# Altium schematic sheet Pic_Sheet.SchDoc
size A4; SheetNumber: 3; SheetTotal: 4
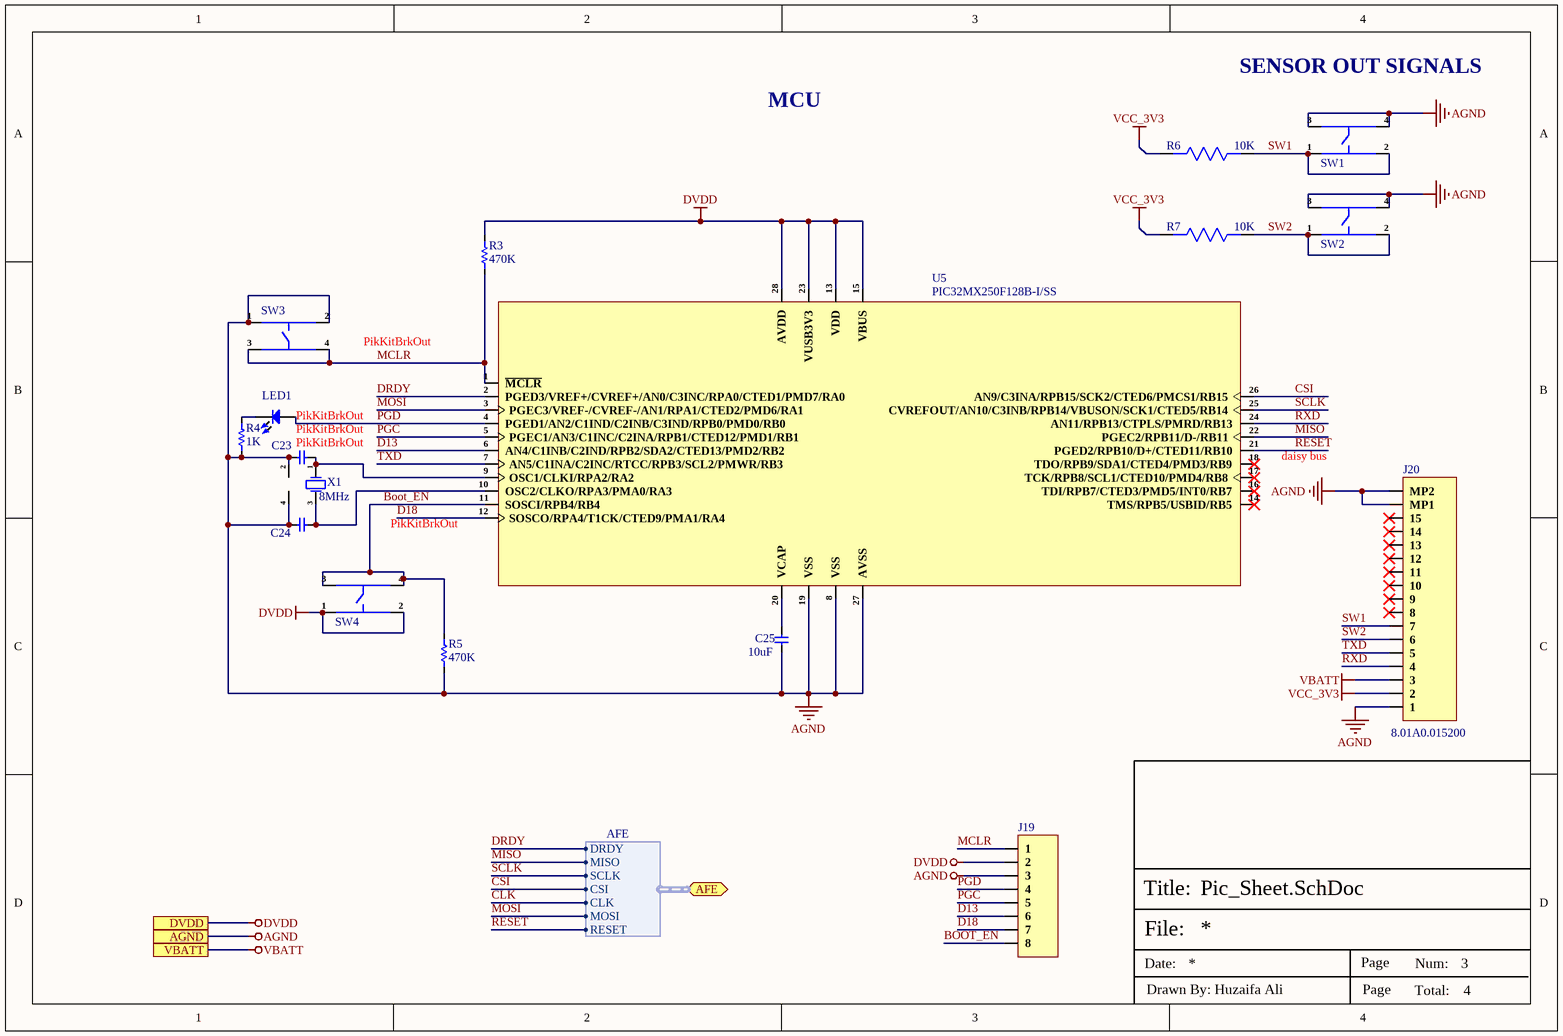
[diagram p0: Pic_Sheet.SchDoc]

## Parts
C23  25pF  [Cap-0402]  (value not drawn)
C24  25pF  [Cap-0402]  (value not drawn)
C25  10uF  [Cap-0402]
J19  SMD PADS (1x8) 2.54mm  [SMD PADS (1x8) 2.54mm]  (value not drawn)
J20  8.01A0.015200  [8.01A0.015200]
LED1  150060BS75000  [LED-0603]  (value not drawn)
R3  470K  [Res-0402]
R4  1K  [Res-0402]
R5  470K  [Res-0402]
R6  10K  [Res-0402]
R7  10K  [Res-0402]
SW1  PTS810SJK250SMTRLFS  [PTS810SJK250SMTR LFS]  (value not drawn)
SW2  PTS810SJK250SMTRLFS  [PTS810SJK250SMTR LFS]  (value not drawn)
SW3  PTS810SJK250SMTRLFS  [PTS810SJK250SMTR LFS]  (value not drawn)
SW4  PTS810SJK250SMTRLFS  [PTS810SJK250SMTR LFS]  (value not drawn)
U5  PIC32MX250F128B-I/SS  [SSOP-28-208mil]
X1  8MHz  [SMD6035-4P]

## Ports
AFE (bidir, harness AFE), AGND, DVDD, VBATT

## Harnesses
AFE: MISO, DRDY, SCLK, CSI, CLK, MOSI, RESET

## Nets
AGND: C23.1 C24.1 C25.1 J19.3 J20.1 J20.MP1 J20.MP2 R4.1 R5.1 SW1.3 SW1.4 SW2.3 SW2.4 SW3.1 SW3.2 U5.8(VSS) U5.19(VSS) U5.27(AVSS) X1.2(GND) X1.4(GND) ; port AGND
DVDD: J19.2 R3.2 SW4.1 SW4.2 U5.13(VDD) U5.15(VBUS) U5.23(VUSB3V3) U5.28(AVDD) ; port DVDD
VBATT: J20.3 ; port VBATT
VCC_3V3: J20.2 R6.2 R7.2
Boot_EN: J19.8 R5.2 SW4.3 SW4.4 U5.11(SOSCI/RPB4/RB4)
CLK: port AFE.CLK
CSI: U5.26(AN9/C3INA/RPB15/SCK2/CTED6/PMCS1/RB15) ; port AFE.CSI
D13: J19.6 U5.6(AN4/C1INB/C2IND/RPB2/SDA2/CTED13/PMD2/RB2)
D18: J19.7 U5.12(SOSCO/RPA4/T1CK/CTED9/PMA1/RA4)
DRDY: U5.2(PGED3/VREF+/CVREF+/AN0/C3INC/RPA0/CTED1/PMD7/RA0) ; port AFE.DRDY
MCLR: J19.1 R3.1 SW3.3 SW3.4 U5.1(~{MCLR})
MISO: U5.22(PGEC2/RPB11/D-/RB11) ; port AFE.MISO
MOSI: U5.3(PGEC3/VREF-/CVREF-/AN1/RPA1/CTED2/PMD6/RA1) ; port AFE.MOSI
PGC: J19.5 U5.5(PGEC1/AN3/C1INC/C2INA/RPB1/CTED12/PMD1/RB1)
PGD: J19.4 LED1.1 U5.4(PGED1/AN2/C1IND/C2INB/C3IND/RPB0/PMD0/RB0)
RESET: U5.21(PGED2/RPB10/D+/CTED11/RB10) ; port AFE.RESET
RXD: J20.4 U5.24(AN11/RPB13/CTPLS/PMRD/RB13)
SCLK: U5.25(CVREFOUT/AN10/C3INB/RPB14/VBUSON/SCK1/CTED5/RB14) ; port AFE.SCLK
SW1: J20.7 R6.1 SW1.1 SW1.2
SW2: J20.6 R7.1 SW2.1 SW2.2
TXD: J20.5 U5.7(AN5/C1INA/C2INC/RTCC/RPB3/SCL2/PMWR/RB3)
NetC23_2: C23.2 U5.9(OSC1/CLKI/RPA2/RA2) X1.1(OSC1)
NetC24_2: C24.2 U5.10(OSC2/CLKO/RPA3/PMA0/RA3) X1.3(OSC2)
NetC25_2: C25.2 U5.20(VCAP)
NetLED1_2: LED1.2 R4.2

Not connected (* = marked no-connect by the designer): J20 8* 9* 10* 11* 12* 13* 14* 15*; U5 14(TMS/RPB5/USBID/RB5)* 16(TDI/RPB7/CTED3/PMD5/INT0/RB7)* 17(TCK/RPB8/SCL1/CTED10/PMD4/RB8)* 18(TDO/RPB9/SDA1/CTED4/PMD3/RB9)*

## Notes on the sheet
- MCU
- SENSOR OUT SIGNALS
- PikKitBrkOut
- (near LED1) PikKitBrkOut
- (near C23) PikKitBrkOut
- (near U5) daisy bus
- File:
- Title:
- Date:
- Page
- Num:
- Total:
- Drawn By: Huzaifa Ali

## Library data of the parts
C23 C24 = CC0402JRNPO9BN250: CAP CER 25PF 50V C0G/NPO 0402; Manufacturer: Yageo; Item Type: Capacitors; Supplier: Mouser; LCSC Part Number: C541363; Manufacturer Part Number: CC0402JRNPO9BN250; RoHS: Yes; Stock: 230189; Case/Package: 0402; Pricing: 1=0.1, 10=0.02, 50=0.02, 100=0.012, 1000=0.01, 10000=0.007 (USD)
C25 = CL05A106MP5NUNC: CAP CER 10UF 10V X5R 0402; Manufacturer: Samsung; Tolerance: 20%; Item Type: Capacitor; Supplier 1: Avnet; Manufacturer Part Number: CL05A106MP5NUNC; RoHS: Yes; Category: Ceramic Capacitors; Stock 1: 1729850; Pricing 1: 10000=0.02537 (USD); Mount: Surface Mount; Case/Package: 0402; Case Code (Metric): 1005; Case Code (Imperial): 0402; Contact Plating: Tin; Min Operating Temperature: -55°C; Max Operating Temperature: 85°C; Package Quantity: 1; Packaging: Tape and Reel; Capacitance: 10uF; Voltage Rating: 10V; Dielectric: X5R; Termination: Wraparound; Series: CL; Construction: Flat; Length: 1mm; Width: 0.02inch; Thickness: 0.028inch; Depth: 0.5mm; Radiation Hardening: No; Lead Free: Lead Free; RoHS Compliant: Yes; ComponentLink1URL: https://datasheet.ciiva.com/25721/cl05a106mp5nunc-25721584.pdf?src-supplier=Digi-Key; ComponentLink1Description: https://datasheet.ciiva.com/25721/cl05a106mp5nunc-25721584.pdf?src-supplier=Digi-Key; ComponentLink2URL: https://datasheet.ciiva.com/26838/getdatasheetpartid-745310-26838170.pdf?src-supplier=Verical; ComponentLink2Description: https://datasheet.ciiva.com/26838/getdatasheetpartid-745310-26838170.pdf?src-supplier=Verical; Supplier Part Number 1: CL05A106MP5NUNC; LCSC Part Number: C315248
J20 = 8.01A0.015200: -40℃~+80℃ 15P Dual-sided contacts / top and bottom connection 0.5mm SMD,P=0.5mm,Surface Mount，Right Angle FFC, FPC (Flat Flexible) Connector Assemblies ROHS; Manufacturer: DIANWEI; Item Type: FFC, FPC Connector; Manufacturer Part Number: 8.01A0.015200; Package: SMD,P=0.5mm,Surface Mount，Right Angle; LCSC Part Number: C19188796; ComponentLink1Description: LCSC; ComponentLink1URL: https://www.lcsc.com/product-detail/FFC-FPC-Flat-Flexible-Connector-Assemblies_DIANWEI-8-01A0-015200_C19188796.html?s_z=n_HC-FPC-05-20-15RLTAG
LED1 = 150060BS75000: LED BLUE CLEAR 0603 SMD; Manufacturer: Wurth Electronics; Manufacturer Part Number: 150060RS75000; Item Type: LEDs; Color: Red; Lens Color: Colorless; Viewing Angle: 140°; Lens Style: Clear,Flat,Rectangular; Luminous Intensity: 250mcd; Forward Current: 30mA; Forward Voltage: 2V; Wavelength: 625nm; Test Current: 20mA; Max Reverse Voltage (DC): 5V; Power Dissipation: 72mW; Lens Size: 0.7mm; Supplier: Rs; LCSC Part Number: C5197644; RoHS: Yes; Stock: 15900; Mounting Technology: Surface Mount; Case/Package: 0603; Case Code (Metric): 1608; Case Code (Imperial): 0603; Min Operating Temperature: -40°C; Max Operating Temperature: 85°C; Package Quantity: 1; Packaging: Cut Tape; Dominant Wavelength: 625nm; Series: WL-SMCW; Lens Transparency: Clear; Reverse Voltage: 5V; Length: 1.6mm; Width: 0.8mm; Height: 0.8mm; RoHS Compliant: Yes; Reach SVHC Compliant: Unknown; ComponentLink1URL: https://datasheet.ciiva.com/29563/150060rs75000-29563040.pdf?src-supplier=Digikey; ComponentLink1Description: https://datasheet.ciiva.com/29563/150060rs75000-29563040.pdf?src-supplier=Digikey; ComponentLink2URL: https://datasheet.ciiva.com/29279/759428-da-01-en-chipled-0603-w-kl-rot-150060rs75000-29279196.pdf?src-supplier=Conrad; ComponentLink2Description: https://datasheet.ciiva.com/29279/759428-da-01-en-chipled-0603-w-kl-rot-150060rs75000-29279196.pdf?src-supplier=Conrad
R3 R5 = RC0402FR-07470KL: RES 470K OHM 1% 1/16W 0402; Manufacturer: Yageo; Value: 470kR; Power Rating: 62.5mW; Voltage Rating: 50V; Temperature Coefficient: 100ppm/°C; Max Power Dissipation: 63mW; Item Type: Resistor; Supplier: Future Electronics; Supplier Part Number: 7702467; Manufacturer Part Number: RC0402FR-07470KL; RoHS: Yes; Category: Chip SMD Resistors; Stock: 330000; Pricing: 10000=0.0009, 50000=0.0008, 300000=0.0008, 1000000=0.0007, 3000000=0.0007 (USD); Case/Package: 0402; Pins: 2; Case Code (Imperial): 0402; Case Code (Metric): 1005; Min Operating Temperature: -55°C; Max Operating Temperature: 155°C; Tolerance: 1%; Packaging: Tape and Reel; Voltage Rating (DC): 50V; Package Quantity: 1; Termination: SMD/SMT; Resistor Type: Thick Film; Number of Terminations: 2; Features: Moisture Resistant; Series: RC; Resistance Tolerance: 1%; Construction: Rectangular; Technology: THICK FILM; Voltage Rating (AC): 50V; Length: 0.039inch; Width: 0.02inch; Height: 0.016inch; Depth: 0.5mm; RoHS Compliant: Yes; Reach SVHC Compliant: No; Military Standard: Not; Lead Free: 5697LeadFree; ComponentLink1URL: https://datasheet.ciiva.com/11819/0900766b80c66297-11819514.pdf?src-supplier=Rs; ComponentLink1Description: https://datasheet.ciiva.com/11819/0900766b80c66297-11819514.pdf?src-supplier=Rs; ComponentLink2URL: https://datasheet.ciiva.com/46412/1018594-46412837.pdf?src-supplier=Element14; ComponentLink2Description: https://datasheet.ciiva.com/46412/1018594-46412837.pdf?src-supplier=Element14; ComponentLink3URL: https://datasheet.ciiva.com/2453/pyu-r-int-thick-7-2453434.pdf?src-supplier=Digi-Key; ComponentLink3Description: https://datasheet.ciiva.com/2453/pyu-r-int-thick-7-2453434.pdf?src-supplier=Digi-Key; ComponentLink4URL: https://datasheet.ciiva.com/2453/pyu-r-int-thick-7-2453435.pdf?src-supplier=Digi-Key; ComponentLink4Description: https://datasheet.ciiva.com/2453/pyu-r-int-thick-7-2453435.pdf?src-supplier=Digi-Key; ComponentLink5URL: https://datasheet.ciiva.com/2453/pyu-r-int-thick-7-2453433.pdf?src-supplier=Digi-Key; ComponentLink5Description: https://datasheet.ciiva.com/2453/pyu-r-int-thick-7-2453433.pdf?src-supplier=Digi-Key; ComponentLink6URL: https://datasheet.ciiva.com/7850/1018594-7850012.pdf?src-supplier=Element14; ComponentLink6Description: https://datasheet.ciiva.com/7850/1018594-7850012.pdf?src-supplier=Element14; ComponentLink7URL: https://datasheet.ciiva.com/7850/1018594-7850013.pdf?src-supplier=Element14; ComponentLink7Description: https://datasheet.ciiva.com/7850/1018594-7850013.pdf?src-supplier=Element14; ComponentLink8URL: https://datasheet.ciiva.com/15189/getdatasheetpartid-325138-15189462.pdf?src-supplier=Verical; ComponentLink8Description: https://datasheet.ciiva.com/15189/getdatasheetpartid-325138-15189462.pdf?src-supplier=Verical; LCSC Part Number: C137976
R4 = RC0402FR-071KL: RES 1K OHM 1% 1/16W 0402; Manufacturer: Yageo; Resistance: 1kR; Temperature Coefficient: 100ppm/°C; Voltage Rating (DC): 50V; Power Rating: 62.5mW; Max Power Dissipation: 63mW; Item Type: Resistor; Supplier 1: Avnet; Manufacturer Part Number: RC0402FR-071KL; RoHS: Yes; Category: Chip SMD Resistors; Stock 1: 13030000; Pricing 1: 10000=0.00085, 20000=0.00087, 40000=0.00084, 60000=0.00083, 80000=0.00079, 100000=0.00078, 1000000=0.00076 (USD); Case/Package: 0402; Number of Pins: 2; Case Code (Imperial): 0402; Case Code (Metric): 1005; Size Code: 0402; Min Operating Temperature: -55°C; Max Operating Temperature: 155°C; Resistor Type: Thick Film; Tolerance: 1%; Packaging: Tape and Reel; Voltage Rating: 50V; Termination: SMD/SMT; Features: Moisture Resistant; Series: RC; Number of Terminations: 2; Resistance Tolerance: 1%; Construction: Rectangular; Technology: THICK FILM; Length: 1mm; Width: 0.5mm; Height: 0.32mm; Depth: 0.5mm; Reach SVHC Compliant: Yes; Lead Free: Lead Free; RoHS Compliant: Yes; Military Standard: Not; ComponentLink1URL: https://datasheet.ciiva.com/11819/0900766b80c66297-11819477.pdf?src-supplier=RSComponents; ComponentLink1Description: https://datasheet.ciiva.com/11819/0900766b80c66297-11819477.pdf?src-supplier=RSComponents; ComponentLink2URL: https://datasheet.ciiva.com/7983/1018594-7983502.pdf?src-supplier=Element14; ComponentLink2Description: https://datasheet.ciiva.com/7983/1018594-7983502.pdf?src-supplier=Element14; ComponentLink3URL: https://datasheet.ciiva.com/22747/1018594-22747513.pdf?src-supplier=Element14; ComponentLink3Description: https://datasheet.ciiva.com/22747/1018594-22747513.pdf?src-supplier=Element14; ComponentLink4URL: https://datasheet.ciiva.com/12666/pyu-rc0402-51-rohs-l-6-r-12666741.pdf?src-supplier=Mouser; ComponentLink4Description: https://datasheet.ciiva.com/12666/pyu-rc0402-51-rohs-l-6-r-12666741.pdf?src-supplier=Mouser; ComponentLink5URL: https://datasheet.ciiva.com/7849/1018594-7849869.pdf?src-supplier=Element14; ComponentLink5Description: https://datasheet.ciiva.com/7849/1018594-7849869.pdf?src-supplier=Element14; ComponentLink6URL: https://datasheet.ciiva.com/7849/1018594-7849871.pdf?src-supplier=Element14; ComponentLink6Description: https://datasheet.ciiva.com/7849/1018594-7849871.pdf?src-supplier=Element14; ComponentLink7URL: https://datasheet.ciiva.com/17063/pyu-rc0402-51-rohs-l-6-r-17063193.pdf?src-supplier=Future+Electronics; ComponentLink7Description: https://datasheet.ciiva.com/17063/pyu-rc0402-51-rohs-l-6-r-17063193.pdf?src-supplier=Future+Electronics; Supplier Part Number 1: RC0402FR-071KL; LCSC Part Number: C106235
R6 R7 = RC0402FR-0710KL: RES 10K OHM 1% 1/16W 0402; Manufacturer: Yageo; Resistance: 10kR; Temperature Coefficient: 100ppm/°C; Voltage Rating (DC): 50V; Power Rating: 62.5mW; Max Power Dissipation: 63mW; Supplier 1: Mouser; Manufacturer Part Number: RC0402FR-0710KL; Stock 1: 18648329; Pricing 1: 1=0.10000, 10=0.01400, 50=0.01400, 100=0.00500, 1000=0.00300, 10000=0.00200 (USD); Case/Package: 0402; Number of Pins: 2; Case Code (Imperial): 0402; Case Code (Metric): 1005; Min Operating Temperature: -55°C; Max Operating Temperature: 155°C; Tolerance: 1%; Packaging: Tape and Reel; Voltage Rating: 50V; Termination: SMD/SMT; Military Standard: Not; Working Voltage: 50V; Number of Terminations: 2; Length: 1mm; Height: 0.32mm; Width: 0.5mm; Depth: 0.5mm; Lead Pitch: 0.2mm; REACH SVHC: No SVHC; Lead Free: Lead Free; ComponentLink1URL: https://datasheet.ciiva.com/7660/38568-7660787.pdf?src-supplier=Element14; ComponentLink1Description: https://datasheet.ciiva.com/7660/38568-7660787.pdf?src-supplier=Element14; ComponentLink2URL: https://datasheet.ciiva.com/7849/1686128-7849814.pdf?src-supplier=Element14; ComponentLink2Description: https://datasheet.ciiva.com/7849/1686128-7849814.pdf?src-supplier=Element14; ComponentLink3URL: https://datasheet.ciiva.com/7983/1018594-7983486.pdf?src-supplier=Element14; ComponentLink3Description: https://datasheet.ciiva.com/7983/1018594-7983486.pdf?src-supplier=Element14; ComponentLink4URL: https://datasheet.ciiva.com/22747/1018594-22747512.pdf?src-supplier=Element14; ComponentLink4Description: https://datasheet.ciiva.com/22747/1018594-22747512.pdf?src-supplier=Element14; Supplier Part Number 1: 603-RC0402FR-0710KL; RoHS: Yes; Category: Chip SMD Resistors; Resistor Type: Thick Film; Features: Moisture Resistant; Series: RC; Resistance Tolerance: 1%; Construction: Rectangular; RoHS Compliant: Yes; ComponentLink5URL: https://datasheet.ciiva.com/12667/pyu-rc0402-51-rohs-l-6-r-12667067.pdf?src-supplier=Mouser; ComponentLink5Description: https://datasheet.ciiva.com/12667/pyu-rc0402-51-rohs-l-6-r-12667067.pdf?src-supplier=Mouser; ComponentLink6URL: https://datasheet.ciiva.com/7849/1784430-7849813.pdf?src-supplier=Element14; ComponentLink6Description: https://datasheet.ciiva.com/7849/1784430-7849813.pdf?src-supplier=Element14; ComponentLink7URL: https://datasheet.ciiva.com/7849/1784430-7849815.pdf?src-supplier=Element14; ComponentLink7Description: https://datasheet.ciiva.com/7849/1784430-7849815.pdf?src-supplier=Element14; LCSC Part Number: C60490
SW1-SW4 = PTS810SJK250SMTRLFS: SWITCH TACTILE SPST-NO 0.05A 16V; Manufacturer: ITT C&K; Item Type: Tactile Switches; Number of Positions: 2NUMBER; Supplier: Rs; LCSC Part Number: C221896; Manufacturer Part Number: PTS810SJK250SMTRLFS; RoHS: Yes; Stock: 100; Lead Free: 5697LeadFree; ComponentLink1URL: https://datasheet.ciiva.com/18514/pts810-4mar13-18514061.pdf?src-supplier=Digikey; ComponentLink1Description: https://datasheet.ciiva.com/18514/pts810-4mar13-18514061.pdf?src-supplier=Digikey; ComponentLink2URL: https://datasheet.ciiva.com/18514/pts810-4mar13-18514062.pdf?src-supplier=Digikey; ComponentLink2Description: https://datasheet.ciiva.com/18514/pts810-4mar13-18514062.pdf?src-supplier=Digikey; ComponentLink3URL: https://datasheet.ciiva.com/18514/pts810-4mar13-18514063.pdf?src-supplier=Digikey; ComponentLink3Description: https://datasheet.ciiva.com/18514/pts810-4mar13-18514063.pdf?src-supplier=Digikey
U5 = PIC32MX250F128B-I/SS: IC MCU 32BIT 128KB FLASH 28SSOP; Manufacturer: Microchip; Supplier: Digikey; LCSC Part Number: C1337166; Manufacturer Part Number: PIC32MX250F128B-I/SS; RoHS: Yes; Item Type: IC; Stock: 1227; Pricing: 1=4.85, 25=4.43, 100=4.02 (USD); ComponentLink1URL: https://datasheet.ciiva.com/14666/0900766b811073be-14666654.pdf?src-supplier=Rs; ComponentLink1Description: https://datasheet.ciiva.com/14666/0900766b811073be-14666654.pdf?src-supplier=Rs; ComponentLink2URL: https://datasheet.ciiva.com/9231/61168d-9231544.pdf?src-supplier=Avnet; ComponentLink2Description: https://datasheet.ciiva.com/9231/61168d-9231544.pdf?src-supplier=Avnet; ComponentLink3URL: https://datasheet.ciiva.com/14131/pic32mx1xx-2xx-eng-tds-14131605.pdf?src-supplier=Distrelec; ComponentLink3Description: https://datasheet.ciiva.com/14131/pic32mx1xx-2xx-eng-tds-14131605.pdf?src-supplier=Distrelec; ComponentLink4URL: https://datasheet.ciiva.com/7665/1538023-7665726.pdf?src-supplier=Element14; ComponentLink4Description: https://datasheet.ciiva.com/7665/1538023-7665726.pdf?src-supplier=Element14; ComponentLink5URL: https://datasheet.ciiva.com/6650/61168e-6650631.pdf?src-supplier=Digikey; ComponentLink5Description: https://datasheet.ciiva.com/6650/61168e-6650631.pdf?src-supplier=Digikey
X1 = ABMM2-8.000MHZ-E2-T: CRYSTAL 8.0000MHZ 18PF SMD; Manufacturer: Abracon; Item Type: Crystals; Supplier: Mouser; LCSC Part Number: C431529; Manufacturer Part Number: ABMM2-8.000MHZ-E2-T; RoHS: Yes; Stock: 10241; Pricing: 1=0.84, 10=0.724, 50=0.724, 100=0.676, 1000=0.493, 10000=0.437 (USD); Lead Free: 5697LeadFree; ComponentLink1URL: https://datasheet.ciiva.com/4945/abmm2-40161-4945441.pdf?src-supplier=Mouser; ComponentLink1Description: https://datasheet.ciiva.com/4945/abmm2-40161-4945441.pdf?src-supplier=Mouser; ComponentLink2URL: https://datasheet.ciiva.com/7998/1682206-7998656.pdf?src-supplier=Element14; ComponentLink2Description: https://datasheet.ciiva.com/7998/1682206-7998656.pdf?src-supplier=Element14; ComponentLink3URL: https://datasheet.ciiva.com/855/abmm2-855405.pdf?src-supplier=Digikey; ComponentLink3Description: https://datasheet.ciiva.com/855/abmm2-855405.pdf?src-supplier=Digikey; ComponentLink4URL: https://datasheet.ciiva.com/855/abmm2-855406.pdf?src-supplier=Digikey; ComponentLink4Description: https://datasheet.ciiva.com/855/abmm2-855406.pdf?src-supplier=Digikey; ComponentLink5URL: https://datasheet.ciiva.com/855/abmm2-855407.pdf?src-supplier=Digikey; ComponentLink5Description: https://datasheet.ciiva.com/855/abmm2-855407.pdf?src-supplier=Digikey; ComponentLink6URL: https://datasheet.ciiva.com/3176/abmm2-3176155.pdf?src-supplier=Avnet; ComponentLink6Description: https://datasheet.ciiva.com/3176/abmm2-3176155.pdf?src-supplier=Avnet